# Altium schematic sheet Connectors.SchDoc: Sample Sheet Title
size B; Date: MM/DD/YYYY; Author: Sample Author; Organization: ORGANIZATION; Address1: ADDRESS 1; Address2: ADDRESS 2; Address3: ADDRESS 3; Address4: ADDRESS 4; Revision: -; SheetNumber: 3; SheetTotal: 4; ENG_APP_DATE: --/--/--; DSN_APP_DATE: --/--/--; CHK_APP_DATE: --/--/--
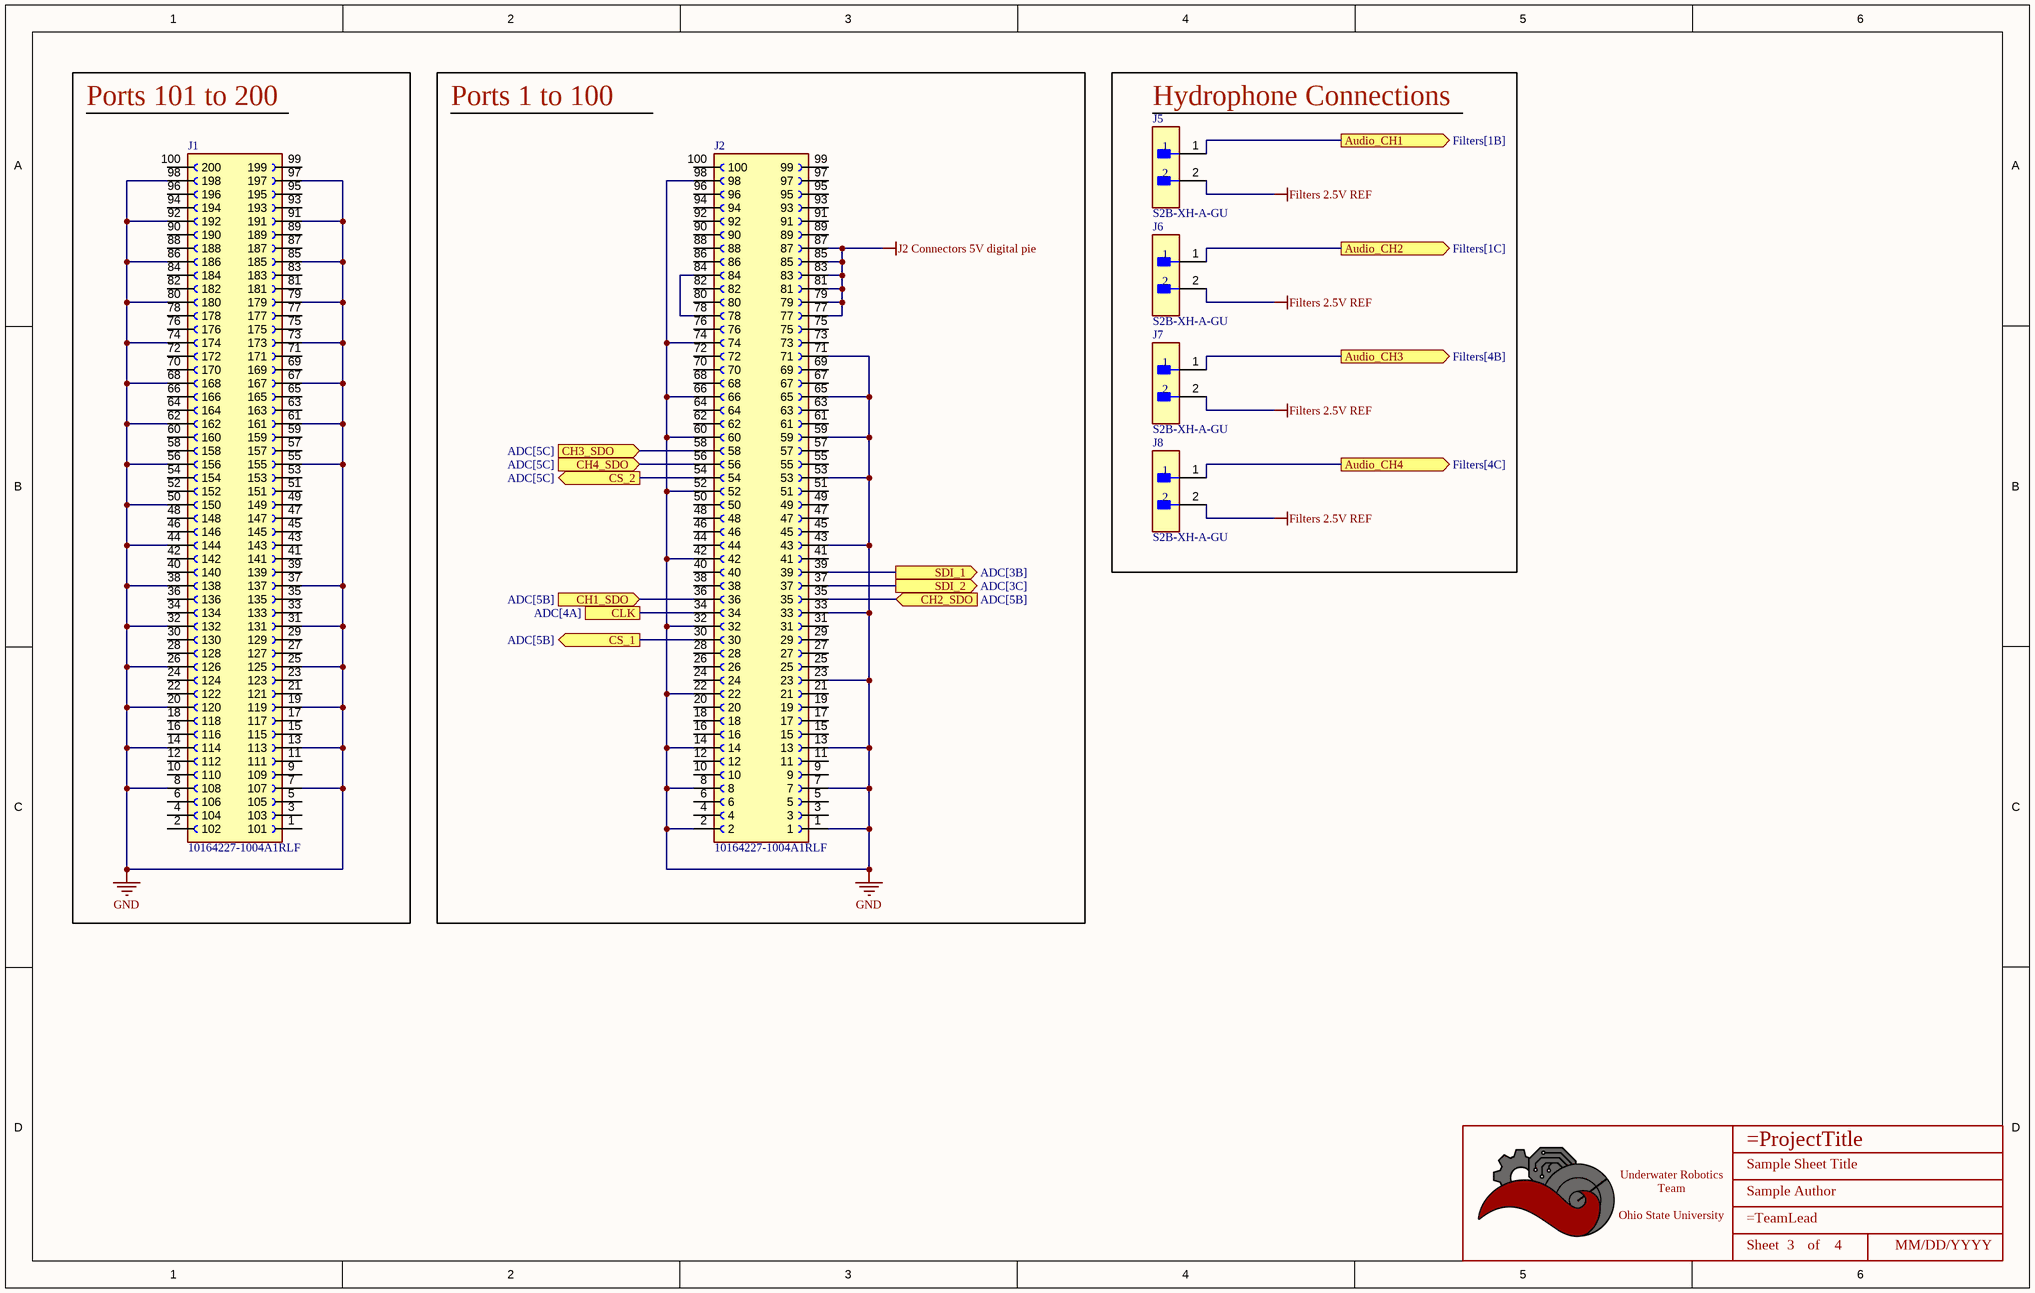
[diagram p0: Connectors.SchDoc]

## Parts
*  Title_Block  [LOGO]  (value not drawn)  (graphical)
J1  10164227-1004A1RLF  [AMPHENOL_10164227-1004A1RLF]
J2  10164227-1004A1RLF  [AMPHENOL_10164227-1004A1RLF]
J5  S2B-XH-A-GU  [FP-S2B-XH-A-GU-MFG]
J6  S2B-XH-A-GU  [FP-S2B-XH-A-GU-MFG]
J7  S2B-XH-A-GU  [FP-S2B-XH-A-GU-MFG]
J8  S2B-XH-A-GU  [FP-S2B-XH-A-GU-MFG]

## Blocks framed on the sheet
Ports 101 to 200: J1
Ports 1 to 100: J2
Hydrophone Connections: J5-J8

## Ports
Audio_CH1 (out, see Filters[1B]), Audio_CH2 (out, see Filters[1C]), Audio_CH3 (out, see Filters[4B]), Audio_CH4 (out, see Filters[4C]), CH1_SDO (in, see ADC[5B]), CH2_SDO (in, see ADC[5B]), CH3_SDO (in, see ADC[5C]), CH4_SDO (in, see ADC[5C]), CLK (see ADC[4A]), CS_1 (out, see ADC[5B]), CS_2 (out, see ADC[5C]), SDI_1 (out, see ADC[3B]), SDI_2 (out, see ADC[3C])

## Nets
Filters 2.5V REF: J5.2 J6.2 J7.2 J8.2
GND: J1.7(107) J1.8(108) J1.13(113) J1.14(114) J1.19(119) J1.20(120) J1.25(125) J1.26(126) J1.31(131) J1.32(132) J1.37(137) J1.38(138) J1.44(144) J1.50(150) J1.55(155) J1.56(156) J1.61(161) J1.62(162) J1.67(167) J1.68(168) J1.73(173) J1.74(174) J1.79(179) J1.80(180) J1.85(185) J1.86(186) J1.91(191) J1.92(192) J1.97(197) J1.98(198) J2.1 J2.2 J2.7 J2.8 J2.13 J2.14 J2.22 J2.23 J2.32 J2.33 J2.42 J2.43 J2.52 J2.53 J2.59 J2.60 J2.65 J2.66 J2.71 J2.74 J2.98
J2 Connectors 5V digital pie: J2.77 J2.79 J2.81 J2.83 J2.85 J2.87
Audio_CH1: J5.1 ; port Audio_CH1
Audio_CH2: J6.1 ; port Audio_CH2
Audio_CH3: J7.1 ; port Audio_CH3
Audio_CH4: J8.1 ; port Audio_CH4
CH1_SDO: J2.36 ; port CH1_SDO
CH2_SDO: J2.35 ; port CH2_SDO
CH3_SDO: J2.58 ; port CH3_SDO
CH4_SDO: J2.56 ; port CH4_SDO
CLK: J2.34 ; port CLK
CS_1: J2.30 ; port CS_1
CS_2: J2.54 ; port CS_2
SDI_1: J2.39 ; port SDI_1
SDI_2: J2.37 ; port SDI_2
NetJ2_78: J2.78 J2.84

Not connected (* = marked no-connect by the designer): J1 1(101) 2(102) 3(103) 4(104) 5(105) 6(106) 9(109) 10(110) 11(111) 12(112) 15(115) 16(116) 17(117) 18(118) 21(121) 22(122) 23(123) 24(124) 27(127) 28(128) 29(129) 30(130) 33(133) 34(134) 35(135) 36(136) 39(139) 40(140) 41(141) 42(142) 43(143) 45(145) 46(146) 47(147) 48(148) 49(149) 51(151) 52(152) 53(153) 54(154) 57(157) 58(158) 59(159) 60(160) 63(163) 64(164) 65(165) 66(166) 69(169) 70(170) 71(171) 72(172) 75(175) 76(176) 77(177) 78(178) 81(181) 82(182) 83(183) 84(184) 87(187) 88(188) 89(189) 90(190) 93(193) 94(194) 95(195) 96(196) 99(199) 100(200); J2 3 4 5 6 9 10 11 12 15 16 17 18 19 20 21 24 25 26 27 28 29 31 38 40 41 44 45 46 47 48 49 50 51 55 57 61 62 63 64 67 68 69 70 72 73 75 76 80 82 86 88 89 90 91 92 93 94 95 96 97 99 100

## Notes on the sheet
- DWG. NO.
- REV.
- SHT.
- THIS DOCUMENT AND THE DATA DISCLOSED HEREIN OR HEREWITH IS THE PROPERTY OF ALTIUM LIMITED AND MAY BE FREELY DISTRIBUTED IN WHOLE. NO RIGHTS ARE RESERVED OR EXPRESS OR IMPLIED WARANTEE GIVEN.
- REVISION
- DESCRIPTION
- DATE
- APPROVED
- ENG:
- APPROVALS
- PROJECT
- DSN:
- CHK:
- REFERENCE DOCUMENTS
- PROJECT REVISION:
- TITLE
- DOCUMENT REVISION:
- DESIGN ITEM:
- BOM:
- FAB DWG:
- PCB DWG:
- ASSY DWG:
- SCALE:
- SIZE
- B
- CAGE CODE
- FILE NAME
- DWG NO.
- SHEET
- OF
- REV
- (in symbol Title_Block) Underwater Robotics Team / Ohio State University; Sheet; of

## Library data of the parts
* = Title_Block: UWRT Schematic Title Block Template / Created June 2021, Dylan Trainor
J1 J2 = CMP-003-000000-1: BergStak 0.40mm, 100 position, Receptacle, 4mm stack height; MF: Amphenol; MP: 101642271004A1RLF; Pin Count: 100; Value: *; SnapEDA_Link: https://www.snapeda.com/parts/101642271004A1RLF/Amphenol/view-part/?ref=snap; Design Item ID: 10164227-1004A1RLF; Check_prices: https://www.snapeda.com/parts/101642271004A1RLF/Amphenol/view-part/?ref=eda; Package: None; Component Type: Standard; Source: 10164227-1004A1RLF.SchLib
J5-J8 = CMP-17439-000226-1: Conn Shrouded Header HDR 2 POS 2.45mm Solder ST Top Entry Thru-Hole; Lead Free: Lead Free